# Altium project TIE_2019_rezolvare.PrjPcb
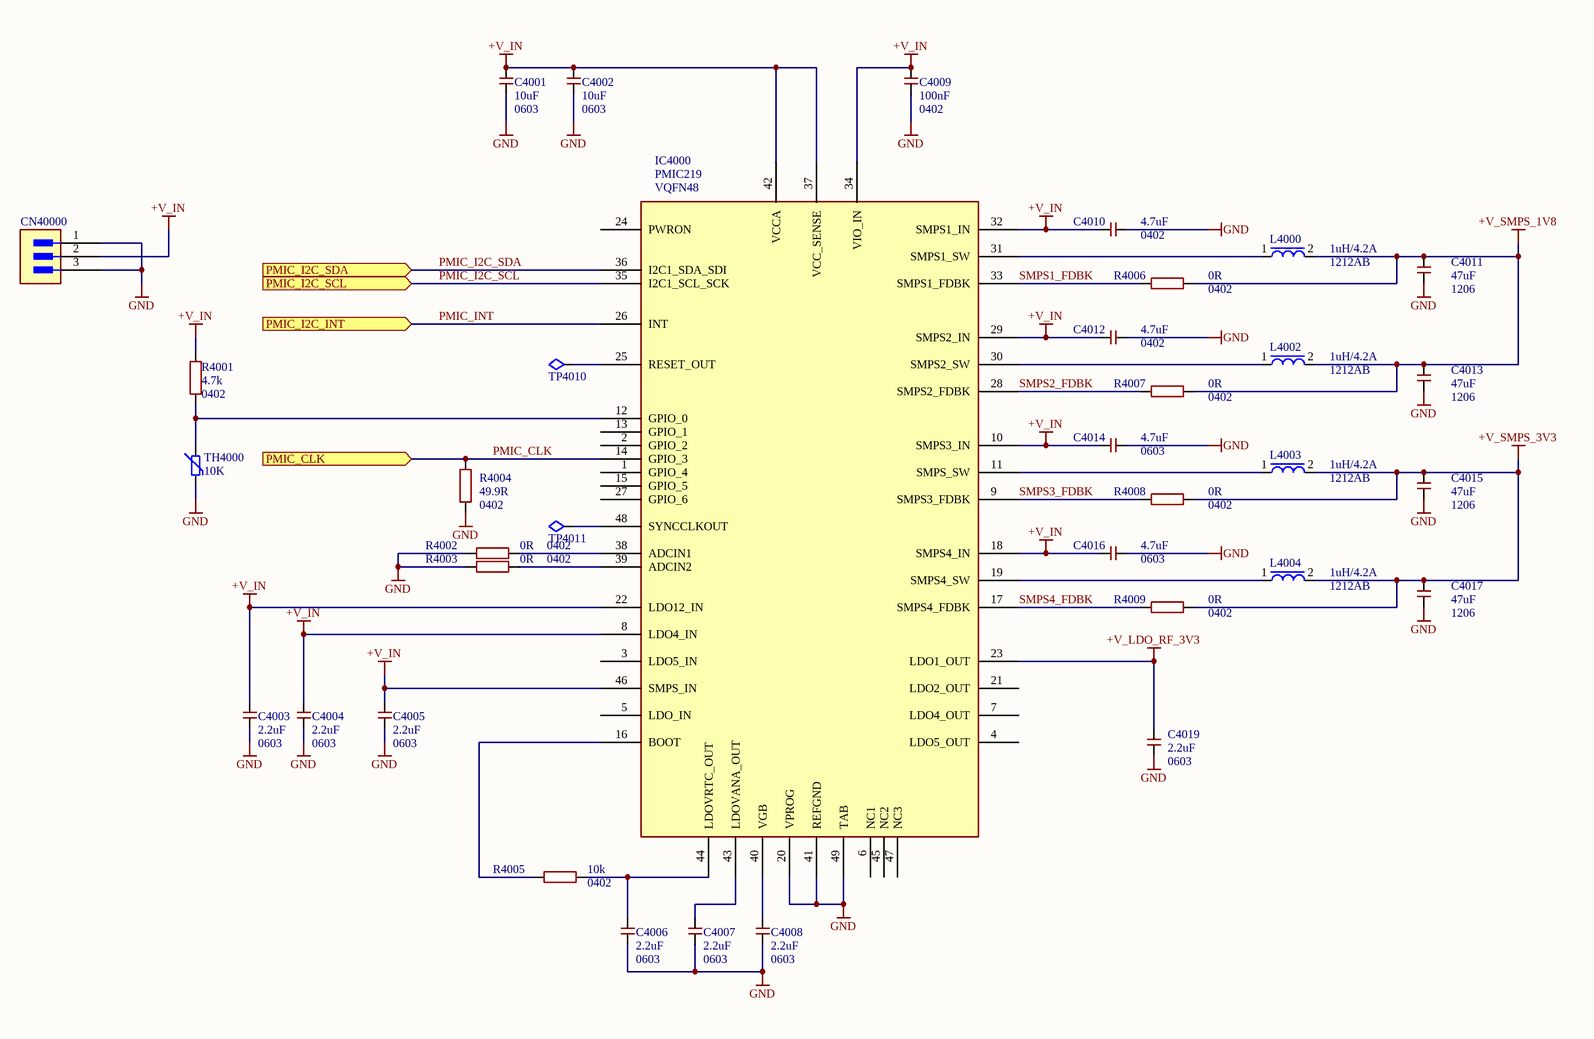
[diagram p0: TIE_2019_rezolvare_page_1.SchDoc]
2 sheets, 97 parts. Net scope: flat (ports and power ports of the same name join across sheets).
Board file: TIE2019_rezolvare.PcbDoc
Sheets:
  TIE_2019_rezolvare_page_1.SchDoc
  TIE_2019_rezolvare_page_2.SchDoc

## Sheet TIE_2019_rezolvare_page_1.SchDoc
size A3; SheetNumber: 1; SheetTotal: 2

### Parts
C4001  10uF  Footprint Name: 0603  [CAP0603]
C4002  10uF  Footprint Name: 0603  [CAP0603]
C4003  2.2uF  Footprint Name: 0603  [CAP0603]
C4004  2.2uF  Footprint Name: 0603  [CAP0603]
C4005  2.2uF  Footprint Name: 0603  [CAP0603]
C4006  2.2uF  Footprint Name: 0603  [CAP0603]
C4007  2.2uF  Footprint Name: 0603  [CAP0603]
C4008  2.2uF  Footprint Name: 0603  [CAP0603]
C4009  100nF  Footprint Name: 0402  [CAP0402]
C4010  4.7uF  Footprint Name: 0402  [CAP0402]
C4011  47uF  Footprint Name: 1206  [CAP1206]
C4012  4.7uF  Footprint Name: 0402  [CAP0402]
C4013  47uF  Footprint Name: 1206  [CAP1206]
C4014  4.7uF  Footprint Name: 0603  [CAP0603]
C4015  47uF  Footprint Name: 1206  [CAP1206]
C4016  4.7uF  Footprint Name: 0603  [CAP0603]
C4017  47uF  Footprint Name: 1206  [CAP1206]
C4019  2.2uF  Footprint Name: 0603  [CAP0603]
CN40000  Connector 1x3  [Conn1x03]  (value not drawn)
IC4000  PMIC219  Footprint: VQFN48  [48-QFN]
L4000  1uH/4.2A  Footprint: 1212AB  [L_1212AB]
L4002  1uH/4.2A  Footprint: 1212AB  [L_1212AB]
L4003  1uH/4.2A  Footprint: 1212AB  [L_1212AB]
L4004  1uH/4.2A  Footprint: 1212AB  [L_1212AB]
R4001  4.7k  Footprint Name: 0402  [RES0402]
R4002  0R  Footprint Name: 0402  [RES0402]
R4003  0R  Footprint Name: 0402  [RES0402]
R4004  49.9R  Footprint Name: 0402  [RES0402]
R4005  10k  Footprint Name: 0402  [RES0402]
R4006  0R  Footprint Name: 0402  [RES0402]
R4007  0R  Footprint Name: 0402  [RES0402]
R4008  0R  Footprint Name: 0402  [RES0402]
R4009  0R  Footprint Name: 0402  [RES0402]
TH4000  10K  [RES0402]
TP4010  TestPoint  [TestPoint_2019]  (value not drawn)  (no BOM)
TP4011  TestPoint  [TestPoint_2019]  (value not drawn)  (no BOM)

### Ports
PMIC_CLK (in, see TIE_2019_rezolvare_page_2[1B]), PMIC_I2C_INT (in, see TIE_2019_rezolvare_page_2[1B]), PMIC_I2C_SCL (in, see TIE_2019_rezolvare_page_2[1B]), PMIC_I2C_SDA (in, see TIE_2019_rezolvare_page_2[1B])

### Nets
+V_IN: C4001.2 C4002.2 C4003.2 C4004.1 C4005.1 C4009.2 C4010.1 C4012.1 C4014.1 C4016.1 CN40000.2 IC4000.8(LDO4_IN) IC4000.10(SMPS3_IN) IC4000.18(SMPS4_IN) IC4000.22(LDO12_IN) IC4000.29(SMPS2_IN) IC4000.32(SMPS1_IN) IC4000.34(VIO_IN) IC4000.37(VCC_SENSE) IC4000.42(VCCA) IC4000.46(SMPS_IN) R4001.2
+V_LDO_RF_3V3: C4019.2 IC4000.23(LDO1_OUT)
+V_SMPS_1V8: C4011.2 C4013.2 L4000.2 L4002.2 R4006.2 R4007.2
+V_SMPS_3V3: C4015.2 C4017.2 L4003.2 L4004.2 R4008.2 R4009.2
GND: C4001.1 C4002.1 C4003.1 C4004.2 C4005.2 C4006.1 C4007.1 C4008.1 C4009.1 C4010.2 C4011.1 C4012.2 C4013.1 C4014.2 C4015.1 C4016.2 C4017.1 C4019.1 CN40000.1 CN40000.3 IC4000.20(VPROG) IC4000.41(REFGND) IC4000.49(TAB) R4002.1 R4003.1 R4004.1 TH4000.1
PMIC_CLK: IC4000.14(GPIO_3) R4004.2 ; port PMIC_CLK
PMIC_I2C_SCL: IC4000.35(I2C1_SCL_SCK) ; port PMIC_I2C_SCL  [project net PMIC_I1C_SCL]
PMIC_I2C_SDA: IC4000.36(I2C1_SDA_SDI) ; port PMIC_I2C_SDA  [project net PMIC_I1C_SDA]
PMIC_INT: IC4000.26(INT) ; port PMIC_I2C_INT
SMPS1_FDBK: IC4000.33(SMPS1_FDBK) R4006.1
SMPS2_FDBK: IC4000.28(SMPS2_FDBK) R4007.1
SMPS3_FDBK: IC4000.9(SMPS3_FDBK) R4008.1
SMPS4_FDBK: IC4000.17(SMPS4_FDBK) R4009.1
NetC4006_2: C4006.2 IC4000.44(LDOVRTC_OUT) R4005.2
NetC4007_2: C4007.2 IC4000.43(LDOVANA_OUT)
NetC4008_2: C4008.2 IC4000.40(VGB)
NetIC4000_11: IC4000.11(SMPS_SW) L4003.1
NetIC4000_12: IC4000.12(GPIO_0) R4001.1 TH4000.2
NetIC4000_16: IC4000.16(BOOT) R4005.1
NetIC4000_19: IC4000.19(SMPS4_SW) L4004.1
NetIC4000_25: IC4000.25(RESET_OUT) TP4010.1
NetIC4000_30: IC4000.30(SMPS2_SW) L4002.1
NetIC4000_31: IC4000.31(SMPS1_SW) L4000.1
NetIC4000_38: IC4000.38(ADCIN1) R4002.2
NetIC4000_39: IC4000.39(ADCIN2) R4003.2
NetIC4000_48: IC4000.48(SYNCCLKOUT) TP4011.1

Not connected (* = marked no-connect by the designer): IC4000 1(GPIO_4) 2(GPIO_2) 3(LDO5_IN) 4(LDO5_OUT) 5(LDO_IN) 6(NC1) 7(LDO4_OUT) 13(GPIO_1) 15(GPIO_5) 21(LDO2_OUT) 24(PWRON) 27(GPIO_6) 45(NC2) 47(NC3)

### Library data of the parts
C4001 C4002 = C0603_10uF: CAP CER 10uF  SMD 0603; Manufacturer: Murata; Manufacturer Part Number: GJM1555C1H100JB01D
C4003-C4008 C4019 = C0603_2.2uF: CAP CER 2.2uF  SMD 0603; Manufacturer: Murata; Manufacturer Part Number: GJM1555C1H100JB01D
C4009 = C0402_100nF: CAP CER 100nF SMD 0402; Manufacturer: Murata; Manufacturer Part Number: GJM1555C1H100JB01D; Parameter 1: 50V
C4010 C4012 = C0402_4.7uF: CAP CER 4.7upF SMD 0402; Manufacturer: Murata; Manufacturer Part Number: GJM1555C1H100JB01D; Parameter 1: 50V
C4011 C4013 C4015 C4017 = C1206_47uF: CAP CER 47uF  SMD 1206; Manufacturer: Murata; Manufacturer Part Number: GJM1555C1H100JB01D
C4014 C4016 = C0603_4.7uF: CAP CER 4.7uF  SMD 0603; Manufacturer: Murata; Manufacturer Part Number: GJM1555C1H100JB01D
L4000 L4002-L4004 = IHLP1212AB
R4001 = R0402_4.7k: RES TKF 4.7k SMD 0402; Manufacturer: TE Connectivity; Manufacturer Part Number: CRG0402F10K; Tolerance: 1%
R4002 R4003 R4006-R4009 = R0402_0R: RES TKF 0R  SMD 0402; Manufacturer: TE Connectivity; Manufacturer Part Number: CRG0402F10K; Tolerance: 1%
R4004 = R0402_49.9R: RES TKF 49.9R SMD 0402; Manufacturer: TE Connectivity; Manufacturer Part Number: CRG0402F10K; Tolerance: 1%
R4005 = R0402_10k: RES TKF 10k  SMD 0402; Manufacturer: TE Connectivity; Manufacturer Part Number: CRG0402F10K; Tolerance: 1%
TH4000 = Thermistor: THERMISTOR 10K OHM  0402
TP4010 TP4011 = TestPoint: SMD test point; Manufacturer: NA; .Checked_PCB: AI; .Creator: RV; .Checked_SCH: AI; Manufacturer Part Number: NA

## Sheet TIE_2019_rezolvare_page_2.SchDoc
size A3; SheetNumber: 2; SheetTotal: 2
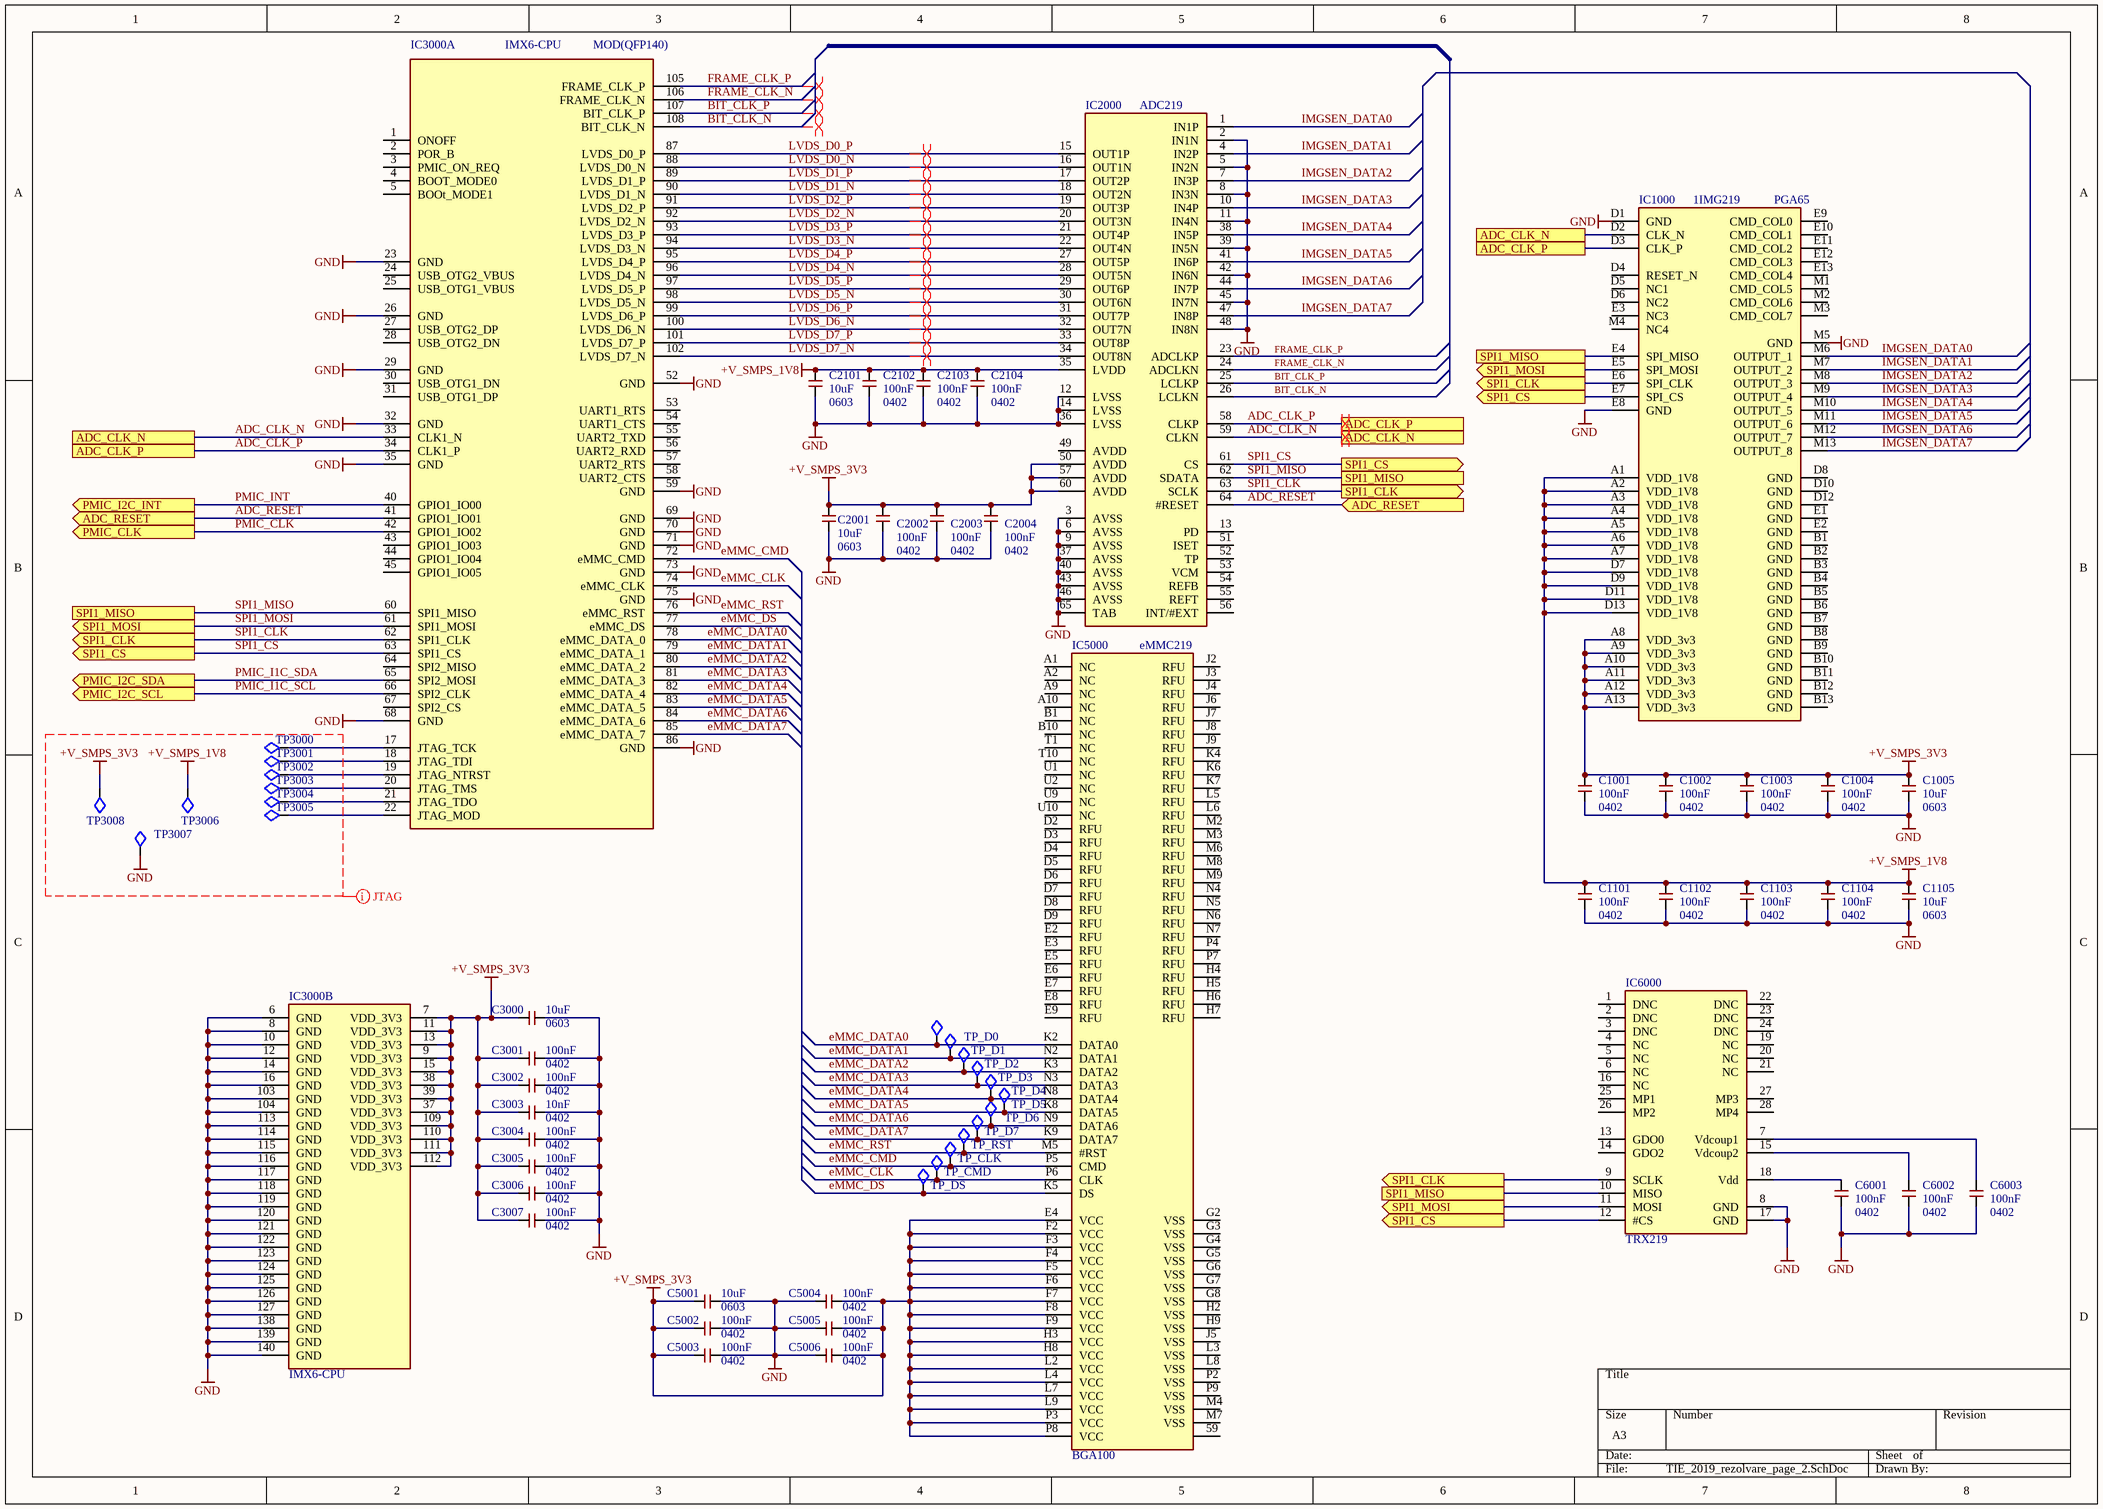
[diagram p1: TIE_2019_rezolvare_page_2.SchDoc]

### Parts
C1001  100nF  Footprint Name: 0402  [CAP0402]
C1002  100nF  Footprint Name: 0402  [CAP0402]
C1003  100nF  Footprint Name: 0402  [CAP0402]
C1004  100nF  Footprint Name: 0402  [CAP0402]
C1005  10uF  Footprint Name: 0603  [CAP0603]
C1101  100nF  Footprint Name: 0402  [CAP0402]
C1102  100nF  Footprint Name: 0402  [CAP0402]
C1103  100nF  Footprint Name: 0402  [CAP0402]
C1104  100nF  Footprint Name: 0402  [CAP0402]
C1105  10uF  Footprint Name: 0603  [CAP0603]
C2001  10uF  Footprint Name: 0603  [CAP0603]
C2002  100nF  Footprint Name: 0402  [CAP0402]
C2003  100nF  Footprint Name: 0402  [CAP0402]
C2004  100nF  Footprint Name: 0402  [CAP0402]
C2101  10uF  Footprint Name: 0603  [CAP0603]
C2102  100nF  Footprint Name: 0402  [CAP0402]
C2103  100nF  Footprint Name: 0402  [CAP0402]
C2104  100nF  Footprint Name: 0402  [CAP0402]
C3000  10uF  Footprint Name: 0603  [CAP0603]
C3001  100nF  Footprint Name: 0402  [CAP0402]
C3002  100nF  Footprint Name: 0402  [CAP0402]
C3003  10nF  Footprint Name: 0402  [CAP0402]
C3004  100nF  Footprint Name: 0402  [CAP0402]
C3005  100nF  Footprint Name: 0402  [CAP0402]
C3006  100nF  Footprint Name: 0402  [CAP0402]
C3007  100nF  Footprint Name: 0402  [CAP0402]
C5001  10uF  Footprint Name: 0603  [CAP0603]
C5002  100nF  Footprint Name: 0402  [CAP0402]
C5003  100nF  Footprint Name: 0402  [CAP0402]
C5004  100nF  Footprint Name: 0402  [CAP0402]
C5005  100nF  Footprint Name: 0402  [CAP0402]
C5006  100nF  Footprint Name: 0402  [CAP0402]
C6001  100nF  Footprint Name: 0402  [CAP0402]
C6002  100nF  Footprint Name: 0402  [CAP0402]
C6003  100nF  Footprint Name: 0402  [CAP0402]
IC1000  PGA65  [PGAx13]
IC2000  ADC219  [QFN64]
IC3000  IMX6-CPU  Footprint: MOD(QFP140)  [IMX6-SoM]  (parts A,B of 2)
IC5000  eMMC219  [BGA100]
IC6000  TRX219  [A1101R09C00GM]
TP3000  TestPoint  [TestPoint_2019]  (value not drawn)  (no BOM)
TP3001  TestPoint  [TestPoint_2019]  (value not drawn)  (no BOM)
TP3002  TestPoint  [TestPoint_2019]  (value not drawn)  (no BOM)
TP3003  TestPoint  [TestPoint_2019]  (value not drawn)  (no BOM)
TP3004  TestPoint  [TestPoint_2019]  (value not drawn)  (no BOM)
TP3005  TestPoint  [TestPoint_2019]  (value not drawn)  (no BOM)
TP3006  TestPoint  [TestPoint_2019]  (value not drawn)  (no BOM)
TP3007  TestPoint  [TestPoint_2019]  (value not drawn)  (no BOM)
TP3008  TestPoint  [TestPoint_2019]  (value not drawn)  (no BOM)
TP_CLK  TestPoint  [TestPoint_2019]  (value not drawn)  (no BOM)
TP_CMD  TestPoint  [TestPoint_2019]  (value not drawn)  (no BOM)
TP_D0  TestPoint  [TestPoint_2019]  (value not drawn)  (no BOM)
TP_D1  TestPoint  [TestPoint_2019]  (value not drawn)  (no BOM)
TP_D2  TestPoint  [TestPoint_2019]  (value not drawn)  (no BOM)
TP_D3  TestPoint  [TestPoint_2019]  (value not drawn)  (no BOM)
TP_D4  TestPoint  [TestPoint_2019]  (value not drawn)  (no BOM)
TP_D5  TestPoint  [TestPoint_2019]  (value not drawn)  (no BOM)
TP_D6  TestPoint  [TestPoint_2019]  (value not drawn)  (no BOM)
TP_D7  TestPoint  [TestPoint_2019]  (value not drawn)  (no BOM)
TP_DS  TestPoint  [TestPoint_2019]  (value not drawn)  (no BOM)
TP_RST  TestPoint  [TestPoint_2019]  (value not drawn)  (no BOM)

### Ports
ADC_CLK_N (see TIE_2019_rezolvare_page_2[1B], TIE_2019_rezolvare_page_2[6A]), ADC_CLK_N (see TIE_2019_rezolvare_page_2[1B], TIE_2019_rezolvare_page_2[6B]), ADC_CLK_N (see TIE_2019_rezolvare_page_2[6A], TIE_2019_rezolvare_page_2[6B]), ADC_CLK_P (see TIE_2019_rezolvare_page_2[1B], TIE_2019_rezolvare_page_2[6A]), ADC_CLK_P (see TIE_2019_rezolvare_page_2[1B], TIE_2019_rezolvare_page_2[6B]), ADC_CLK_P (see TIE_2019_rezolvare_page_2[6A], TIE_2019_rezolvare_page_2[6B]), ADC_RESET (in, see TIE_2019_rezolvare_page_2[1B]), ADC_RESET (out, see TIE_2019_rezolvare_page_2[6B]), PMIC_CLK (out, see TIE_2019_rezolvare_page_1[2B]), PMIC_I2C_INT (out, see TIE_2019_rezolvare_page_1[2B]), PMIC_I2C_SCL (out, see TIE_2019_rezolvare_page_1[2B]), PMIC_I2C_SDA (out, see TIE_2019_rezolvare_page_1[2B]), SPI1_CLK (out, see TIE_2019_rezolvare_page_2[1B], TIE_2019_rezolvare_page_2[6B]), SPI1_CLK (out, see TIE_2019_rezolvare_page_2[1B], TIE_2019_rezolvare_page_2[6B], TIE_2019_rezolvare_page_2[6D]), SPI1_CLK (out, see TIE_2019_rezolvare_page_2[6B], TIE_2019_rezolvare_page_2[6D]), SPI1_CS (out, see TIE_2019_rezolvare_page_2[1B], TIE_2019_rezolvare_page_2[6B]), SPI1_CS (out, see TIE_2019_rezolvare_page_2[1B], TIE_2019_rezolvare_page_2[6B], TIE_2019_rezolvare_page_2[6D]), SPI1_CS (out, see TIE_2019_rezolvare_page_2[6B], TIE_2019_rezolvare_page_2[6D]), SPI1_MISO (see TIE_2019_rezolvare_page_2[1B], TIE_2019_rezolvare_page_2[6A], TIE_2019_rezolvare_page_2[6B]), SPI1_MISO (see TIE_2019_rezolvare_page_2[1B], TIE_2019_rezolvare_page_2[6A], TIE_2019_rezolvare_page_2[6D]), SPI1_MISO (see TIE_2019_rezolvare_page_2[1B], TIE_2019_rezolvare_page_2[6B], TIE_2019_rezolvare_page_2[6D]), SPI1_MISO (see TIE_2019_rezolvare_page_2[6A], TIE_2019_rezolvare_page_2[6B], TIE_2019_rezolvare_page_2[6D]), SPI1_MOSI (out, see TIE_2019_rezolvare_page_2[1B], TIE_2019_rezolvare_page_2[6A]), SPI1_MOSI (out, see TIE_2019_rezolvare_page_2[1B], TIE_2019_rezolvare_page_2[6D]), SPI1_MOSI (out, see TIE_2019_rezolvare_page_2[6A], TIE_2019_rezolvare_page_2[6D])

### Nets
+V_SMPS_1V8: C1101.2 C1102.2 C1103.2 C1104.2 C1105.2 C2101.2 C2102.2 C2103.2 C2104.2 IC1000.A1(VDD_1V8) IC1000.A2(VDD_1V8) IC1000.A3(VDD_1V8) IC1000.A4(VDD_1V8) IC1000.A5(VDD_1V8) IC1000.A6(VDD_1V8) IC1000.A7(VDD_1V8) IC1000.D7(VDD_1V8) IC1000.D9(VDD_1V8) IC1000.D11(VDD_1V8) IC1000.D13(VDD_1V8) IC2000.35(LVDD) TP3006.1
+V_SMPS_3V3: C1001.2 C1002.2 C1003.2 C1004.2 C1005.2 C2001.2 C2002.2 C2003.2 C2004.2 C3000.1 C3001.1 C3002.1 C3003.1 C3004.1 C3005.1 C3006.1 C3007.1 C5001.1 C5002.1 C5003.1 C5004.2 C5005.2 C5006.2 IC1000.A8(VDD_3v3) IC1000.A9(VDD_3v3) IC1000.A10(VDD_3v3) IC1000.A11(VDD_3v3) IC1000.A12(VDD_3v3) IC1000.A13(VDD_3v3) IC2000.50(AVDD) IC2000.57(AVDD) IC2000.60(AVDD) IC3000.7(VDD_3V3) IC3000.9(VDD_3V3) IC3000.11(VDD_3V3) IC3000.13(VDD_3V3) IC3000.15(VDD_3V3) IC3000.37(VDD_3V3) IC3000.38(VDD_3V3) IC3000.39(VDD_3V3) IC3000.109(VDD_3V3) IC3000.110(VDD_3V3) IC3000.111(VDD_3V3) IC3000.112(VDD_3V3) IC5000.E4(VCC) IC5000.F2(VCC) IC5000.F3(VCC) IC5000.F4(VCC) IC5000.F5(VCC) IC5000.F6(VCC) IC5000.F7(VCC) IC5000.F8(VCC) IC5000.F9(VCC) IC5000.H3(VCC) IC5000.H8(VCC) IC5000.L2(VCC) IC5000.L4(VCC) IC5000.L7(VCC) IC5000.L9(VCC) IC5000.P3(VCC) IC5000.P8(VCC) TP3008.1
GND: C1001.1 C1002.1 C1003.1 C1004.1 C1005.1 C1101.1 C1102.1 C1103.1 C1104.1 C1105.1 C2001.1 C2002.1 C2003.1 C2004.1 C2101.1 C2102.1 C2103.1 C2104.1 C3000.2 C3001.2 C3002.2 C3003.2 C3004.2 C3005.2 C3006.2 C3007.2 C5001.2 C5002.2 C5003.2 C5004.1 C5005.1 C5006.1 C6001.1 C6002.1 C6003.1 IC1000.D1(GND) IC1000.E8(GND) IC1000.M5(GND) IC2000.2(IN1N) IC2000.3(AVSS) IC2000.5(IN2N) IC2000.6(AVSS) IC2000.8(IN3N) IC2000.9(AVSS) IC2000.11(IN4N) IC2000.12(LVSS) IC2000.14(LVSS) IC2000.36(LVSS) IC2000.37(AVSS) IC2000.39(IN5N) IC2000.40(AVSS) IC2000.42(IN6N) IC2000.43(AVSS) IC2000.45(IN7N) IC2000.46(AVSS) IC2000.48(IN8N) IC2000.65(TAB) IC3000.6(GND) IC3000.8(GND) IC3000.10(GND) IC3000.12(GND) IC3000.14(GND) IC3000.16(GND) IC3000.23(GND) IC3000.26(GND) IC3000.29(GND) IC3000.32(GND) IC3000.35(GND) IC3000.52(GND) IC3000.59(GND) IC3000.68(GND) IC3000.69(GND) IC3000.70(GND) IC3000.71(GND) IC3000.73(GND) IC3000.75(GND) IC3000.86(GND) IC3000.103(GND) IC3000.104(GND) IC3000.113(GND) IC3000.114(GND) IC3000.115(GND) IC3000.116(GND) IC3000.117(GND) IC3000.118(GND) IC3000.119(GND) IC3000.120(GND) IC3000.121(GND) IC3000.122(GND) IC3000.123(GND) IC3000.124(GND) IC3000.125(GND) IC3000.126(GND) IC3000.127(GND) IC3000.138(GND) IC3000.139(GND) IC3000.140(GND) IC6000.8(GND) IC6000.17(GND) TP3007.1
ADC_CLK_N: IC1000.D2(CLK_N) IC2000.59(CLKN) IC3000.33(CLK1_N) ; port ADC_CLK_N
ADC_CLK_P: IC1000.D3(CLK_P) IC2000.58(CLKP) IC3000.34(CLK1_P) ; port ADC_CLK_P
ADC_RESET: IC2000.64(#RESET) IC3000.41(GPIO1_IO01) ; port ADC_RESET
BIT_CLK_N: IC2000.26(LCLKN) IC3000.108(BIT_CLK_N)
BIT_CLK_P: IC2000.25(LCLKP) IC3000.107(BIT_CLK_P)
eMMC_CLK: IC3000.74(eMMC_CLK) IC5000.P6(CLK) TP_CMD.1
eMMC_CMD: IC3000.72(eMMC_CMD) IC5000.P5(CMD) TP_CLK.1
eMMC_DATA0: IC3000.78(eMMC_DATA_0) IC5000.K2(DATA0) TP_D0.1
eMMC_DATA1: IC3000.79(eMMC_DATA_1) IC5000.N2(DATA1) TP_D1.1
eMMC_DATA2: IC3000.80(eMMC_DATA_2) IC5000.K3(DATA2) TP_D2.1
eMMC_DATA3: IC3000.81(eMMC_DATA_3) IC5000.N3(DATA3) TP_D3.1
eMMC_DATA4: IC3000.82(eMMC_DATA_4) IC5000.N8(DATA4) TP_D4.1
eMMC_DATA5: IC3000.83(eMMC_DATA_5) IC5000.K8(DATA5) TP_D5.1
eMMC_DATA6: IC3000.84(eMMC_DATA_6) IC5000.N9(DATA6) TP_D6.1
eMMC_DATA7: IC3000.85(eMMC_DATA_7) IC5000.K9(DATA7) TP_D7.1
eMMC_DS: IC3000.77(eMMC_DS) IC5000.K5(DS) TP_DS.1
eMMC_RST: IC3000.76(eMMC_RST) IC5000.M5(#RST) TP_RST.1
FRAME_CLK_N: IC2000.24(ADCLKN) IC3000.106(FRAME_CLK_N)
FRAME_CLK_P: IC2000.23(ADCLKP) IC3000.105(FRAME_CLK_P)
IMGSEN_DATA0: IC1000.M6(OUTPUT_1) IC2000.1(IN1P)
IMGSEN_DATA1: IC1000.M7(OUTPUT_2) IC2000.4(IN2P)
IMGSEN_DATA2: IC1000.M8(OUTPUT_3) IC2000.7(IN3P)
IMGSEN_DATA3: IC1000.M9(OUTPUT_4) IC2000.10(IN4P)
IMGSEN_DATA4: IC1000.M10(OUTPUT_5) IC2000.38(IN5P)
IMGSEN_DATA5: IC1000.M11(OUTPUT_6) IC2000.41(IN6P)
IMGSEN_DATA6: IC1000.M12(OUTPUT_7) IC2000.44(IN7P)
IMGSEN_DATA7: IC1000.M13(OUTPUT_8) IC2000.47(IN8P)
LVDS_D0_N: IC2000.16(OUT1N) IC3000.88(LVDS_D0_N)
LVDS_D0_P: IC2000.15(OUT1P) IC3000.87(LVDS_D0_P)
LVDS_D1_N: IC2000.18(OUT2N) IC3000.90(LVDS_D1_N)
LVDS_D1_P: IC2000.17(OUT2P) IC3000.89(LVDS_D1_P)
LVDS_D2_N: IC2000.20(OUT3N) IC3000.92(LVDS_D2_N)
LVDS_D2_P: IC2000.19(OUT3P) IC3000.91(LVDS_D2_P)
LVDS_D3_N: IC2000.22(OUT4N) IC3000.94(LVDS_D3_N)
LVDS_D3_P: IC2000.21(OUT4P) IC3000.93(LVDS_D3_P)
LVDS_D4_N: IC2000.28(OUT5N) IC3000.96(LVDS_D4_N)
LVDS_D4_P: IC2000.27(OUT5P) IC3000.95(LVDS_D4_P)
LVDS_D5_N: IC2000.30(OUT6N) IC3000.98(LVDS_D5_N)
LVDS_D5_P: IC2000.29(OUT6P) IC3000.97(LVDS_D5_P)
LVDS_D6_N: IC2000.32(OUT7N) IC3000.100(LVDS_D6_N)
LVDS_D6_P: IC2000.31(OUT7P) IC3000.99(LVDS_D6_P)
LVDS_D7_N: IC2000.34(OUT8N) IC3000.102(LVDS_D7_N)
LVDS_D7_P: IC2000.33(OUT8P) IC3000.101(LVDS_D7_P)
PMIC_CLK: IC3000.42(GPIO1_IO02) ; port PMIC_CLK
PMIC_I1C_SCL: IC3000.66(SPI2_CLK) ; port PMIC_I2C_SCL
PMIC_I1C_SDA: IC3000.65(SPI2_MOSI) ; port PMIC_I2C_SDA
PMIC_INT: IC3000.40(GPIO1_IO00) ; port PMIC_I2C_INT
SPI1_CLK: IC1000.E6(SPI_CLK) IC2000.63(SCLK) IC3000.62(SPI1_CLK) IC6000.9(SCLK) ; port SPI1_CLK
SPI1_CS: IC1000.E7(SPI_CS) IC2000.61(CS) IC3000.63(SPI1_CS) IC6000.12(#CS) ; port SPI1_CS
SPI1_MISO: IC1000.E4(SPI_MISO) IC2000.62(SDATA) IC3000.60(SPI1_MISO) IC6000.10(MISO) ; port SPI1_MISO
SPI1_MOSI: IC1000.E5(SPI_MOSI) IC3000.61(SPI1_MOSI) IC6000.11(MOSI) ; port SPI1_MOSI
NetC6001_2: C6001.2 IC6000.18(Vdd)
NetC6002_2: C6002.2 IC6000.15(Vdcoup2)
NetC6003_2: C6003.2 IC6000.7(Vdcoup1)
NetIC3000_17: IC3000.17(JTAG_TCK) TP3000.1
NetIC3000_18: IC3000.18(JTAG_TDI) TP3001.1
NetIC3000_19: IC3000.19(JTAG_NTRST) TP3002.1
NetIC3000_20: IC3000.20(JTAG_TMS) TP3003.1
NetIC3000_21: IC3000.21(JTAG_TDO) TP3004.1
NetIC3000_22: IC3000.22(JTAG_MOD) TP3005.1

Not connected (* = marked no-connect by the designer): IC1000 B1(GND) B2(GND) B3(GND) B4(GND) B5(GND) B6(GND) B7(GND) B8(GND) B9(GND) B10(GND) B11(GND) B12(GND) B13(GND) D4(RESET_N) D5(NC1) D6(NC2) D8(GND) D10(GND) D12(GND) E1(GND) E2(GND) E3(NC3) E9(CMD_COL0) E10(CMD_COL1) E11(CMD_COL2) E12(CMD_COL3) E13(CMD_COL4) M1(CMD_COL5) M2(CMD_COL6) M3(CMD_COL7) M4(NC4); IC2000 13(PD) 49(AVDD) 51(ISET) 52(TP) 53(VCM) 54(REFB) 55(REFT) 56(INT/#EXT); IC3000 1(ONOFF) 2(POR_B) 3(PMIC_ON_REQ) 4(BOOT_MODE0) 5(BOOt_MODE1) 24(USB_OTG2_VBUS) 25(USB_OTG1_VBUS) 27(USB_OTG2_DP) 28(USB_OTG2_DN) 30(USB_OTG1_DN) 31(USB_OTG1_DP) 43(GPIO1_IO03) 44(GPIO1_IO04) 45(GPIO1_IO05) 53(UART1_RTS) 54(UART1_CTS) 55(UART2_TXD) 56(UART2_RXD) 57(UART2_RTS) 58(UART2_CTS) 64(SPI2_MISO) 67(SPI2_CS); IC5000 59 A1(NC) A2(NC) A9(NC) A10(NC) B1(NC) B10(NC) D2(RFU) D3(RFU) D4(RFU) D5(RFU) D6(RFU) D7(RFU) D8(RFU) D9(RFU) E2(RFU) E3(RFU) E5(RFU) E6(RFU) E7(RFU) E8(RFU) E9(RFU) G2(VSS) G3(VSS) G4(VSS) G5(VSS) G6(VSS) G7(VSS) G8(VSS) H2(VSS) H4(RFU) H5(RFU) H6(RFU) H7(RFU) H9(VSS) J2(RFU) J3(RFU) J4(RFU) J5(VSS) J6(RFU) J7(RFU) J8(RFU) J9(RFU) K4(RFU) K6(RFU) K7(RFU) L3(VSS) L5(RFU) L6(RFU) L8(VSS) M2(RFU) M3(RFU) M4(VSS) M6(RFU) M7(VSS) M8(RFU) M9(RFU) N4(RFU) N5(RFU) N6(RFU) N7(RFU) P2(VSS) P4(RFU) P7(RFU) P9(VSS) T1(NC) T10(NC) U1(NC) U2(NC) U9(NC) U10(NC); IC6000 1(DNC) 2(DNC) 3(DNC) 4(NC) 5(NC) 6(NC) 13(GDO0) 14(GDO2) 16(NC) 19(NC) 20(NC) 21(NC) 22(DNC) 23(DNC) 24(DNC) 25(MP1) 26(MP2) 27(MP3) 28(MP4)

### Layout directives
mark named JTAG: +V_SMPS_1V8, +V_SMPS_3V3, GND
differential pair: ADC_CLK_N, ADC_CLK_P, BIT_CLK_N, BIT_CLK_P, FRAME_CLK_N, FRAME_CLK_P, LVDS_D0_N, LVDS_D0_P, LVDS_D1_N, LVDS_D1_P, LVDS_D2_N, LVDS_D2_P, LVDS_D3_N, LVDS_D3_P, LVDS_D4_N, LVDS_D4_P, LVDS_D5_N, LVDS_D5_P, LVDS_D6_N, LVDS_D6_P, LVDS_D7_N, LVDS_D7_P

### Library data of the parts
C1001-C1004 C1101-C1104 C2002-C2004 C2102-C2104 C3001 C3002 C3004-C3007 C5002-C5006 C6001-C6003 = C0402_100nF: as C4009 on sheet TIE_2019_rezolvare_page_1
C1005 C1105 C2001 C2101 C3000 C5001 = C0603_10uF: as C4001 on sheet TIE_2019_rezolvare_page_1
C3003 = C0402_10nF: CAP CER 10nF SMD 0402; Manufacturer: Murata; Manufacturer Part Number: GJM1555C1H100JB01D; Parameter 1: 50V
IC1000 = 1IMG219: Footprint: 1IMG219
IC3000 = IMX6-CPU: 528MHz NXP i.MX 6UL/6ULL ARM Cortex-A7 Processors
IC5000 = eMMC219: BGA100
IC6000 = TRX219: MOD26
TP3000-TP3008 TP_CLK TP_CMD TP_D0-TP_D7 TP_DS TP_RST = TestPoint: as TP4010 on sheet TIE_2019_rezolvare_page_1; .Checked_SCH: AI; Manufacturer Part Number: NA

## Nets that join several sheets
+V_SMPS_1V8: TIE_2019_rezolvare_page_1 (6 pins), TIE_2019_rezolvare_page_2 (22 pins)
+V_SMPS_3V3: TIE_2019_rezolvare_page_1 (6 pins), TIE_2019_rezolvare_page_2 (62 pins)
GND: TIE_2019_rezolvare_page_1 (27 pins), TIE_2019_rezolvare_page_2 (100 pins)
PMIC_CLK: TIE_2019_rezolvare_page_1 (IC4000.14 R4004.2), TIE_2019_rezolvare_page_2 (IC3000.42)
PMIC_I1C_SCL: TIE_2019_rezolvare_page_1 (IC4000.35), TIE_2019_rezolvare_page_2 (IC3000.66)
PMIC_I1C_SDA: TIE_2019_rezolvare_page_1 (IC4000.36), TIE_2019_rezolvare_page_2 (IC3000.65)
PMIC_INT: TIE_2019_rezolvare_page_1 (IC4000.26), TIE_2019_rezolvare_page_2 (IC3000.40)